# Altium schematic sheet BUCK_V1.2.SchDoc
size 292 x 203 mm
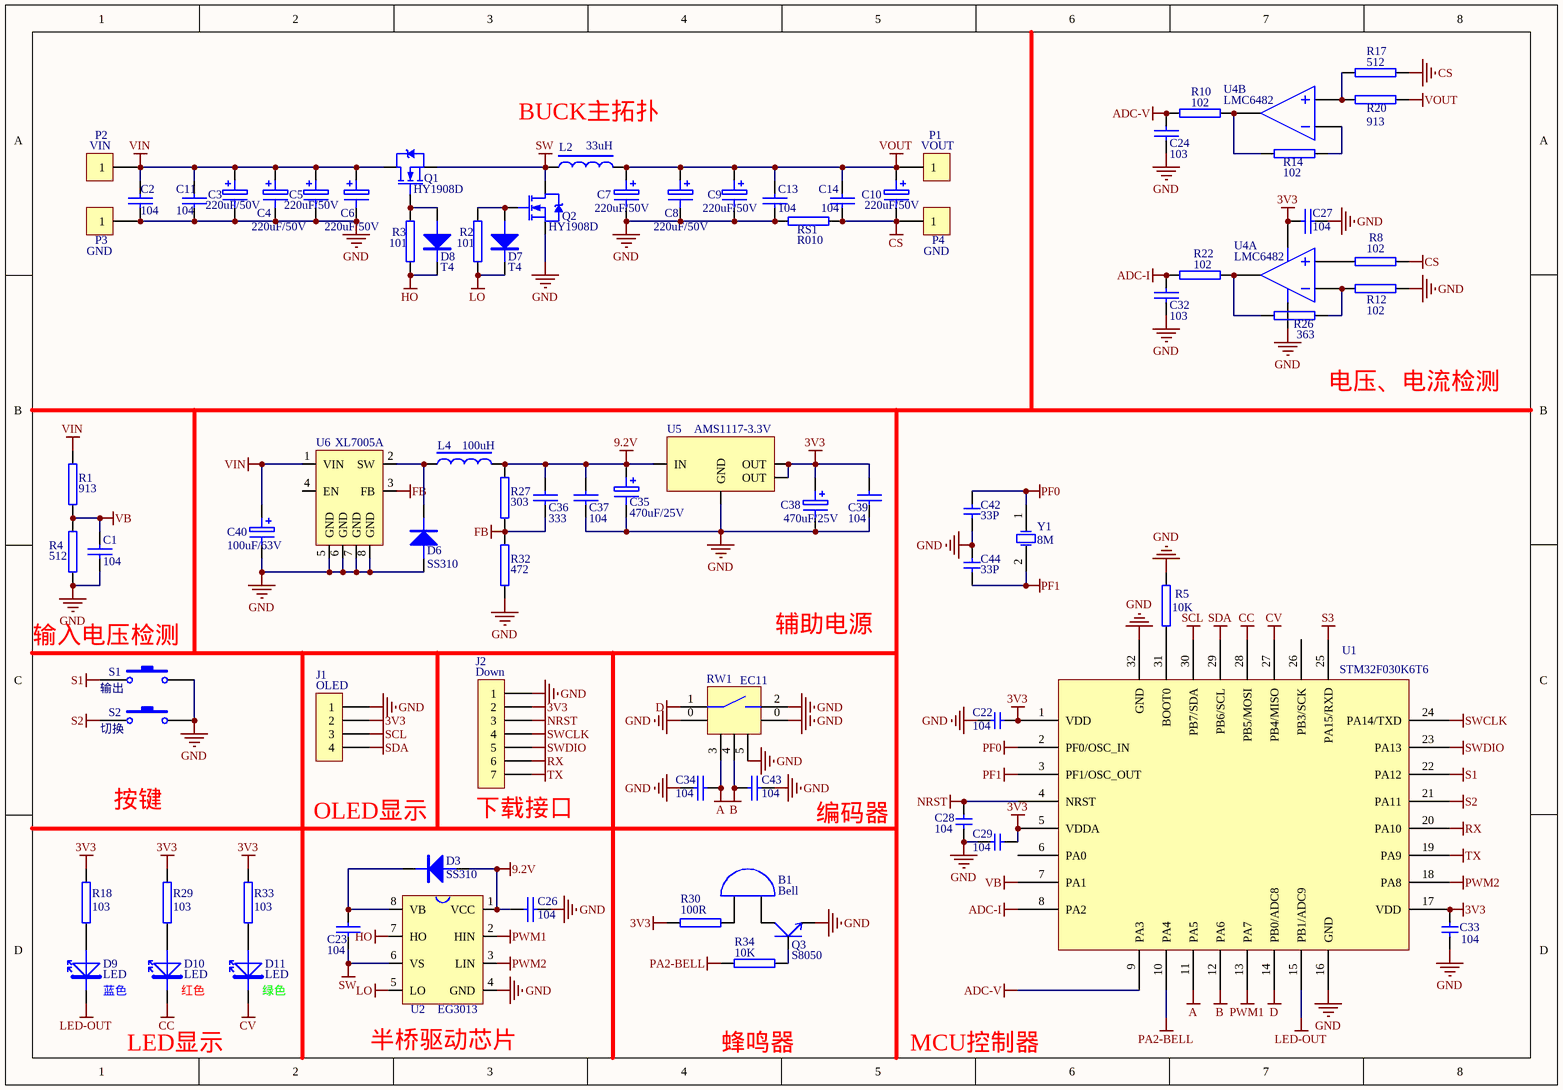
[diagram p0: BUCK_V1.2.SchDoc]

## Parts
B1  Bell  [BELL]
C1  104  [0604]
C2  104  [0806]
C3  220uF/50V  [CE-10MM]
C4  220uF/50V  [CE-10MM]
C5  220uF/50V  [CE-10MM]
C6  220uF/50V  [CE-10MM]
C7  220uF/50V  [CE-10MM]
C8  220uF/50V  [CE-10MM]
C9  220uF/50V  [CE-10MM]
C10  220uF/50V  [CE-10MM]
C11  104  [0806]
C13  104  [0806]
C14  104  [0806]
C22  104  [0604]
C23  104  [0806]
C24  103  [0604]
C26  104  [0806]
C27  104  [0604]
C28  104  [0604]
C29  104  [0604]
C32  103  [0604]
C33  104  [0604]
C34  104  [0604]
C35  470uF/25V  [CE-8MM]
C36  333  [0604]
C37  104  [0806]
C38  470uF/25V  [CE-8MM]
C39  104  [0806]
C40  100uF/63V  [CE-8MM]
C42  33P  [0604]
C43  104  [0604]
C44  33P  [0604]
D3  SS310  [DIODE]
D6  SS310  [DIODE]
D7  T4  [DIODE2]
D8  T4  [DIODE2]
D9  LED  [LED]
D10  LED  [LED]
D11  LED  [LED]
J1  OLED  [OLED-1264]
J2  Down  [SIP7]
L2  33uH  [L - 1]
L4  100uH  [L7X7X4.5]
P1  VOUT  [M3]
P2  VIN  [M3]
P3  GND  [M3]
P4  GND  [M3]
Q1  HY1908D  [sot-252]
Q2  HY1908D  [sot-252]
Q3  S8050  [SOT-23]
R1  913  [0603]
R2  101  [0805]
R3  101  [0805]
R4  512  [0603]
R5  10K  [0603]
R8  102  [0603]
R10  102  [0603]
R12  102  [0603]
R14  102  [0603]
R17  512  [0603]
R18  103  [0603]
R20  913  [0603]
R22  102  [0603]
R26  363  [0603]
R27  303  [0603]
R29  103  [0603]
R30  100R  [0603]
R32  472  [0603]
R33  103  [0603]
R34  10K  [0603]
RS1  R010  [2512]
RW1  EC11  [EC11]
S1  输出  [SW-SMT-6X6MM]
S2  切换  [SW-SMT-6X6MM]
U1  STM32F030K6T6  [LQFP-32]
U2  EG3013  [SOP-8]
U4  LMC6482  [SOP-8]  (parts A,B of 2)
U5  AMS1117-3.3V  [SOT-223]
U6  XL7005A  [SOP-8]
Y1  8M  [JZ]

## Nets
3V3: C22.1 C27.2 C29.2 C33.1 C38.1 C39.1 J1.2 J2.2 R18.2 R29.2 R30.1 R33.2 U1.1(VDD) U1.5(VDDA) U1.17(VDD) U4.8 U5.2(OUT) U5.4(OUT)
9.2V: C26.1 C35.1 C36.1 C37.1 D3.1 L4.2 R27.1 U2.1(VCC) U5.3(IN)
A: C34.2 RW1.3 U1.11(PA5)
ADC-I: C32.1 R22.1 U1.8(PA2)
ADC-V: C24.1 R10.1 U1.9(PA3)
B: C43.1 RW1.4 U1.12(PA6)
CC: D10.2 U1.28(PB5/MOSI)
CS: C10.2 C14.1 P4.1 R8.2 R17.2 RS1.1
CV: D11.2 U1.27(PB4/MISO)
D: RW1.1 U1.14(PB0/ADC8)
FB: C36.2 R27.2 R32.1 U6.3(FB)
GND: C1.1 C2.1 C3.2 C4.2 C5.2 C6.2 C7.2 C8.2 C9.2 C11.1 C13.1 C22.2 C24.2 C26.2 C27.1 C28.2 C29.1 C32.2 C33.2 C34.1 C35.2 C37.2 C38.2 C39.2 C40.2 C42.1 C43.2 C44.2 D6.1 J1.1 J2.1 P3.1 Q2.3(S) Q3.2(E) R4.2 R5.1 R12.2 R32.2 RS1.2 RW1.0 RW1.2 RW1.5 S1.2 S2.2 U1.16(GND) U1.32(GND) U2.4(GND) U4.4 U5.1(GND) U6.5(GND) U6.6(GND) U6.7(GND) U6.8(GND)
HO: D8.2 R3.2 U2.7(HO)
LED-OUT: D9.2 U1.15(PB1/ADC9)
LO: D7.2 R2.2 U2.5(LO)
NRST: C28.1 J2.3 U1.4(NRST)
PA2-BELL: R34.1 U1.10(PA4)
PF0: C42.2 U1.2(PF0/OSC_IN) Y1.1(OSC1)
PF1: C44.1 U1.3(PF1/OSC_OUT) Y1.2(OSC2)
PWM1: U1.13(PA7) U2.2(HIN)
PWM2: U1.18(PA8) U2.3(LIN)
RX: J2.6 U1.20(PA10)
S1: S1.1 U1.22(PA12)
S2: S2.1 U1.21(PA11)
S3: U1.25(PA15/RXD)
SCL: J1.3 U1.30(PB7/SDA)
SDA: J1.4 U1.29(PB6/SCL)
SW: C23.1 L2.1 Q1.3(S) Q2.2(D) U2.6(VS)
SWCLK: J2.4 U1.24(PA14/TXD)
SWDIO: J2.5 U1.23(PA13)
TX: J2.7 U1.19(PA9)
VB: C1.2 R1.2 R4.1 U1.7(PA1)
VIN: C2.2 C3.1 C4.1 C5.1 C6.1 C11.2 C40.1 P2.1 Q1.2(D) R1.1 U6.1(VIN)
VOUT: C7.1 C8.1 C9.1 C10.1 C13.2 C14.2 L2.2 P1.1 R20.2
NetB1_1: B1.1(A) R30.2
NetB1_2: B1.2(B) Q3.3(C)
NetC23_2: C23.2 D3.2 U2.8(VB)
NetD6_2: D6.2 L4.1 U6.2(SW)
NetD7_1: D7.1 Q2.1(G) R2.1
NetD8_1: D8.1 Q1.1(G) R3.1
NetD9_1: D9.1 R18.1
NetD10_1: D10.1 R29.1
NetD11_1: D11.1 R33.1
NetQ3_1: Q3.1(B) R34.2
NetR5_2: R5.2 U1.31(BOOT0)
NetR8_1: R8.1 U4.3
NetR10_2: R10.2 R14.1 U4.7
NetR12_1: R12.1 R26.2 U4.2
NetR14_2: R14.2 U4.6
NetR17_1: R17.1 R20.1 U4.5
NetR22_2: R22.2 R26.1 U4.1

Not connected (* = marked no-connect by the designer): U1 6(PA0) 26(PB3/SCK); U6 4(EN)

## Notes on the sheet
- BUCK主拓扑
- 电压、电流检测
- 辅助电源
- 输入电压检测
- 按键
- OLED显示
- (near J2) 下载接口
- 编码器
- (near D9) 蓝色
- (near D10) 红色
- (near D11) 绿色
- LED显示
- (near U2) 半桥驱动芯片
- 蜂鸣器
- MCU控制器

## Library data of the parts
B1 = Bell: Electrical Bell; Published: 24-Mar-1999; LatestRevisionDate: 17-Jul-2002; LatestRevisionNote: Re-released for DXP Platform.; PackageReference: PIN2; Publisher: Altium Limited
C1 C2 C11 C13 C14 C22-C24 C26-C29 C32-C34 C36 C37 C39 C42-C44 = CAP
C3-C10 C35 C38 C40 = ELECTRO1
D3 D6-D8 = DIODE
J1 = CON4
J2 = CON7
L2 L4 = INDUCTOR2
P1-P4 = CON1
Q1 Q2 = MOS N: Manufacturer: International Rectifier; Class: Discrete; SubClass: MOSFET - Power; Note: Pin 2 is electrically connected to the Heatsink (4).; Published: 8/06/2000; Publisher: Altium Hobart Technology Centre
Q3 = NPN-EBC
R1-R5 R8 R10 R12 R14 R17 R18 R20 R22 R26 R27 R29 R30 R32-R34 RS1 = RES2
S1 S2 = SW-PB: Switch
U4 = AMP-8
U5 = AMS1117
Y1 = XTAL: Crystal Oscillator; Published: 8-Jun-2000; LatestRevisionDate: 17-Jul-2002; LatestRevisionNote: Re-released for DXP Platform.; PackageReference: R38; Publisher: Altium Limited